# Altium schematic sheet RS485_RS232_Sheet.SchDoc
size A4; SheetNumber: 7; SheetTotal: 8
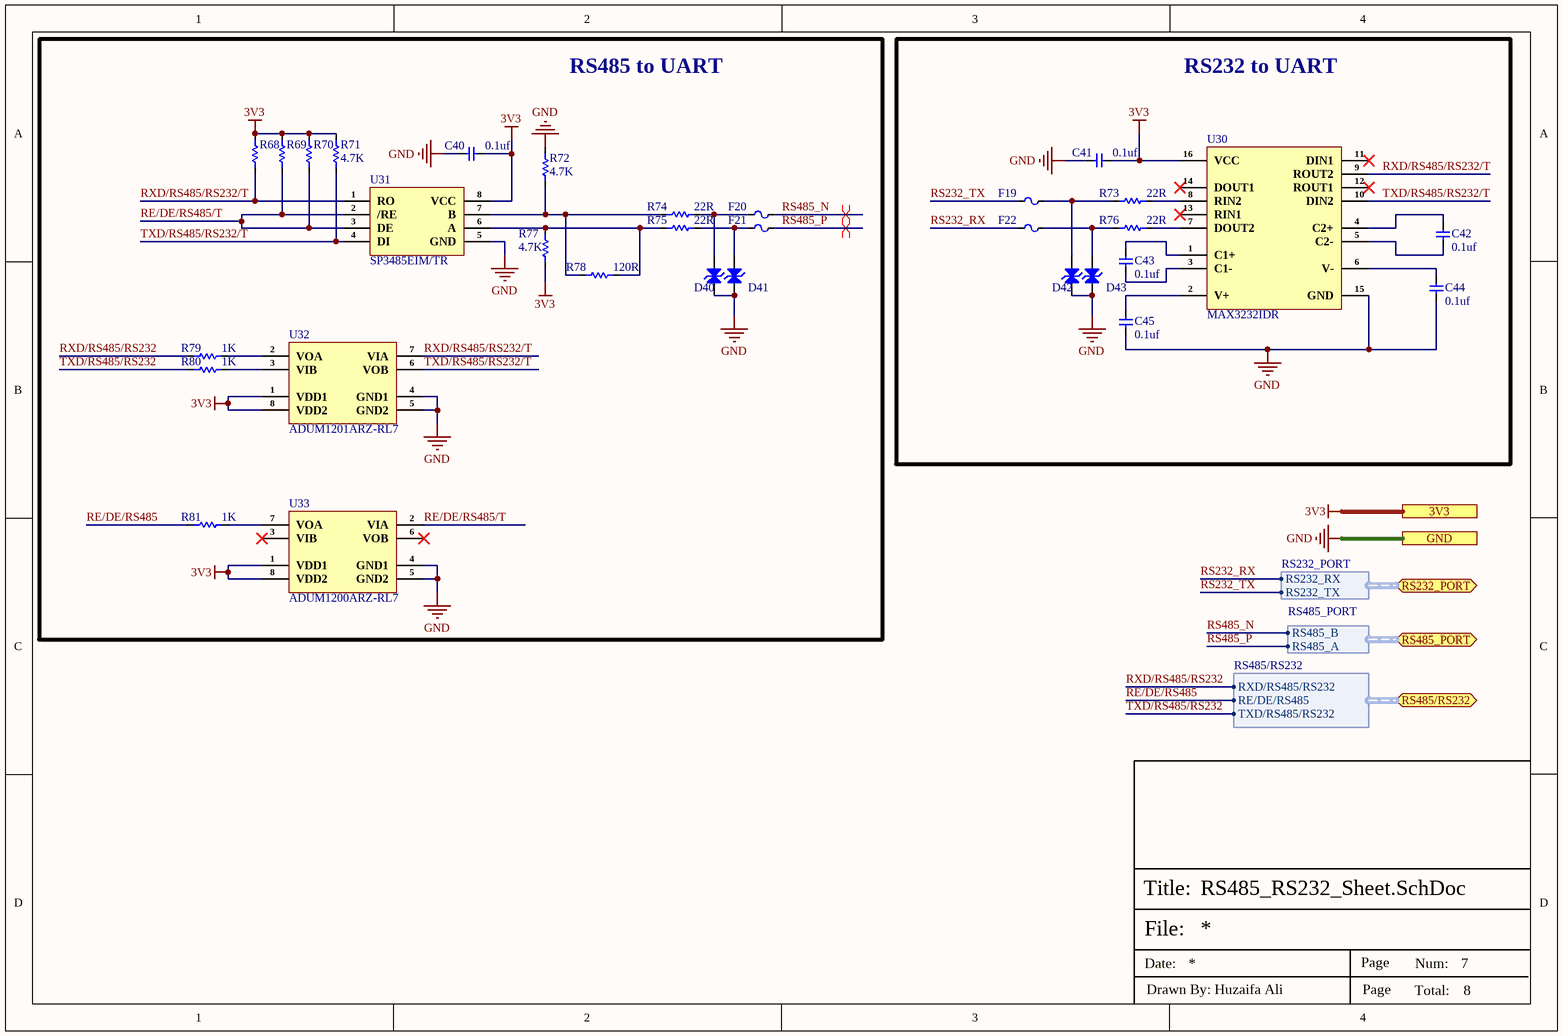
[diagram p0: RS485_RS232_Sheet.SchDoc]

## Parts
C40  0.1uf  [Cap-0402]
C41  0.1uf  [Cap-0402]
C42  0.1uf  [Cap-0402]
C43  0.1uf  [Cap-0402]
C44  0.1uf  [Cap-0402]
C45  0.1uf  [Cap-0402]
D40  SMBJ26CA  [SMB_]  (value not drawn)
D41  SMBJ26CA  [SMB_]  (value not drawn)
D42  SMBJ26CA  [SMB_]  (value not drawn)
D43  SMBJ26CA  [SMB_]  (value not drawn)
F19  SMD0805P020TF  [Fuse-0805]  (value not drawn)
F20  SMD0805P020TF  [Fuse-0805]  (value not drawn)
F21  SMD0805P020TF  [Fuse-0805]  (value not drawn)
F22  SMD0805P020TF  [Fuse-0805]  (value not drawn)
R68  4.7K  [Res-0402]  (value not drawn)
R69  4.7K  [Res-0402]  (value not drawn)
R70  4.7K  [Res-0402]  (value not drawn)
R71  4.7K  [Res-0402]
R72  4.7K  [Res-0402]
R73  22R  [Res-0402]
R74  22R  [Res-0402]
R75  22R  [Res-0402]
R76  22R  [Res-0402]
R77  4.7K  [Res-0402]
R78  120R  [Res-0603]
R79  1K  [Res-0201]
R80  1K  [Res-0201]
R81  1K  [Res-0201]
U30  MAX3232IDR  [SOIC-16]
U31  SP3485EIM/TR  [SOP-8]
U32  ADUM1201ARZ-RL7  [SOIC-8]
U33  ADUM1200ARZ-RL7  [SOIC-8]

## Blocks framed on the sheet
RS485 to UART: C40 D40 D41 F20 F21 R68-R72 R74 R75 R77-R81 U31-U33
RS232 to UART: C41-C45 D42 D43 F19 F22 R73 R76 U30

## Ports
3V3, GND, RS232_PORT (bidir, harness RS232_PORT), RS485/RS232 (bidir, harness RS485/RS232), RS485_PORT (bidir, harness RS485_PORT)

## Harnesses
RS485_PORT: RS485_B, RS485_A
RS232_PORT: RS232_RX, RS232_TX
RS485/RS232: RXD/RS485/RS232, RE/DE/RS485, TXD/RS485/RS232

## Nets
3V3: C40.1 C41.1 R68.2 R69.2 R70.2 R71.2 R77.1 U30.16(VCC) U31.8(VCC) U32.1(VDD1) U32.8(VDD2) U33.1(VDD1) U33.8(VDD2) ; port 3V3
GND: C40.2 C41.2 C44.2 C45.2 D40.1(A) D41.1(A) D42.1(A) D43.1(A) R72.2 U30.15(GND) U31.5(GND) U32.4(GND1) U32.5(GND2) U33.4(GND1) U33.5(GND2) ; port GND
RE/DE/RS485: R81.2 ; port RS485/RS232.RE/DE/RS485
RE/DE/RS485/T: R69.1 R70.1 U31.2(/RE) U31.3(DE) U33.2(VIA)
RS232_RX: F22.1 ; port RS232_PORT.RS232_RX
RS232_TX: F19.1 ; port RS232_PORT.RS232_TX
RS485_N: F20.2 ; port RS485_PORT.RS485_B
RS485_P: F21.2 ; port RS485_PORT.RS485_A
RXD/RS485/RS232: R79.2 ; port RS485/RS232.RXD/RS485/RS232
RXD/RS485/RS232/T: R68.1 U30.9(ROUT2) U31.1(RO) U32.7(VIA)
TXD/RS485/RS232: R80.2 ; port RS485/RS232.TXD/RS485/RS232
TXD/RS485/RS232/T: R71.1 U30.10(DIN2) U31.4(DI) U32.6(VOB)
NetC42_1: C42.1 U30.4(C2+)
NetC42_2: C42.2 U30.5(C2-)
NetC43_1: C43.1 U30.1(C1+)
NetC43_2: C43.2 U30.3(C1-)
NetC44_1: C44.1 U30.6(V-)
NetC45_1: C45.1 U30.2(V+)
NetD40_2: D40.2(K) F20.1 R74.2
NetD41_2: D41.2(K) F21.1 R75.2
NetD42_2: D42.2(K) F19.2 R73.1
NetD43_2: D43.2(K) F22.2 R76.1
NetR72_1: R72.1 R74.1 R78.1 U31.7(B)
NetR73_2: R73.2 U30.8(RIN2)
NetR75_1: R75.1 R77.2 R78.2 U31.6(A)
NetR76_2: R76.2 U30.7(DOUT2)
NetR79_1: R79.1 U32.2(VOA)
NetR80_1: R80.1 U32.3(VIB)
NetR81_1: R81.1 U33.7(VOA)

Not connected (* = marked no-connect by the designer): U30 11(DIN1)* 12(ROUT1)* 13(RIN1)* 14(DOUT1)*; U33 3(VIB)* 6(VOB)*

## Layout directives
differential pair; net class RS485; differential pair class RS485_LINES; rule Impedance Constraint [Min = 115.0    Max = 120.0    ]; rule Matched Net Lengths [Tolerance = 0.508mm]: RS485_N, RS485_P

## Notes on the sheet
- File:
- Title:
- Date:
- Page
- Num:
- Total:
- Drawn By: Huzaifa Ali

## Library data of the parts
C40-C45 = GRM155R62A104KE14D: CAP CER 0.1UF 100V X5R 0402; Manufacturer: Murata; Capacitance: 100nF; Tolerance: 10%; Item Type: Capacitor; Supplier 1: Arrow Electronics; Manufacturer Part Number: GRM155R62A104KE14D; RoHS: Yes; Category: Ceramic Capacitors; Stock 1: 870000; Pricing 1: 10000=0.00500, 20000=0.00410, 30000=0.00390, 50000=0.00370, 100000=0.00300 (USD); Mount: Surface Mount; Case/Package: 0402; Case Code (Metric): 1005; Case Code (Imperial): 0402; Weight: 0.000212oz; Min Operating Temperature: -55°C; Max Operating Temperature: 85°C; Packaging: Tape and Reel; Voltage Rating: 100V; Dielectric: X5R; Termination: SMD/SMT; Voltage Rating (DC): 100V; Package Quantity: 10000; Series: GRM; Length: 0.039inch; Width: 0.02inch; Height: 0.5mm; Thickness: 0.022inch; Reach SVHC Compliant: Yes; Lead Free: Lead Free; RoHS Compliant: Yes; ComponentLink1URL: http://www.farnell.com/datasheets/2079151.pdf?src-supplier=Farnell; ComponentLink1Description: http://www.farnell.com/datasheets/2079151.pdf?src-supplier=Farnell; ComponentLink2URL: http://www.mouser.com/ds/2/281/c02e-2905.pdf?src-supplier=Mouser; ComponentLink2Description: http://www.mouser.com/ds/2/281/c02e-2905.pdf?src-supplier=Mouser; ComponentLink3URL: http://www.farnell.com/datasheets/2079151.pdf?src-supplier=Element14; ComponentLink3Description: http://www.farnell.com/datasheets/2079151.pdf?src-supplier=Element14; ComponentLink4URL: http://search.murata.co.jp/Ceramy/image/img/A01X/G101/ENG/GRM155R62A104KE14-01.pdf?src-supplier=Digi-Key; ComponentLink4Description: http://search.murata.co.jp/Ceramy/image/img/A01X/G101/ENG/GRM155R62A104KE14-01.pdf?src-supplier=Digi-Key; ComponentLink5URL: http://www.farnell.com/datasheets/2079151.pdf?src-supplier=Newark; ComponentLink5Description: http://www.farnell.com/datasheets/2079151.pdf?src-supplier=Newark; Supplier Part Number 1: GRM155R62A104KE14D; LCSC Part Number: C162178
D40-D43 = SMBJ26CA: SMB(DO-214AA) TVS ROHS; Manufacturer: MSKSEMI; Item Type: Diode; Manufacturer Part Number: SMBJ26CA; Package: SMB(DO-214AA); LCSC Part Number: C5331111; ComponentLink1Description: LCSC; ComponentLink1URL: https://www.lcsc.com/product-detail/TVS_MSKSEMI-SMBJ26CA_C5331111.html
F19-F22 = SMD0805P020TF: 9V 200mA 100A 500mA 0805 Resettable Fuses ROHS; Manufacturer: RUILON; Item Type: Fuse; Manufacturer Part Number: SMD0805P020TF; Package: 0805; LCSC Part Number: C20976; ComponentLink1Description: LCSC; ComponentLink1URL: https://www.lcsc.com/product-detail/Resettable-Fuses_RUILON-Shenzhen-Ruilongyuan-Elec-SMD0805P020TF_C20976.html
R68-R72 R77 = RC0402FR-074K7L: RES 4.7K OHM 1% 1/16W 0402; Manufacturer: Yageo; Voltage Rating (DC): 50V; Power Rating: 62.5mW; Resistance: 4.7kR; Temperature Coefficient: 100ppm/°C; Max Power Dissipation: 63mW; Item Type: Resistor; Supplier 1: Avnet; Manufacturer Part Number: RC0402FR-074K7L; RoHS: Yes; Category: Chip SMD Resistors; Stock 1: 2420000; Pricing 1: 10000=0.00085 (USD); Case/Package: 0402; Number of Pins: 2; Case Code (Imperial): 0402; Case Code (Metric): 1005; Size Code: 0402; Min Operating Temperature: -55°C; Max Operating Temperature: 155°C; Tolerance: 1%; Voltage Rating: 50V; Packaging: Tape and Reel; Resistor Type: Thick Film; Termination: SMD/SMT; Features: Moisture Resistant; Series: RC; Number of Terminations: 2; Resistance Tolerance: 1%; Construction: Rectangular; Length: 1mm; Width: 0.5mm; Height: 0.32mm; Depth: 0.5mm; Height - Seated (Max): 0.016inch; RoHS Compliant: Yes; Reach SVHC Compliant: Yes; Military Standard: Not; Lead Free: Lead Free; ComponentLink1URL: https://datasheet.ciiva.com/22661/1686128-22661342.pdf?src-supplier=Element14; ComponentLink1Description: https://datasheet.ciiva.com/22661/1686128-22661342.pdf?src-supplier=Element14; ComponentLink2URL: https://datasheet.ciiva.com/7850/1018594-7850022.pdf?src-supplier=Element14; ComponentLink2Description: https://datasheet.ciiva.com/7850/1018594-7850022.pdf?src-supplier=Element14; ComponentLink3URL: https://datasheet.ciiva.com/7850/1018594-7850023.pdf?src-supplier=Element14; ComponentLink3Description: https://datasheet.ciiva.com/7850/1018594-7850023.pdf?src-supplier=Element14; ComponentLink4URL: https://datasheet.ciiva.com/15215/getdatasheetpartid-328119-15215035.pdf?src-supplier=Verical; ComponentLink4Description: https://datasheet.ciiva.com/15215/getdatasheetpartid-328119-15215035.pdf?src-supplier=Verical; Supplier Part Number 1: RC0402FR-074K7L; LCSC Part Number: C105871
R73-R76 = RCS040222R0FKED: RES SMD 22 OHM 1% 1/5W 0402; Manufacturer: Vishay Dale; Max Power Dissipation: 200mW; Temperature Coefficient: 100ppm/°C; Supplier 1: Digi-Key; Manufacturer Part Number: RCS040222R0FKED; Stock 1: 8456; Pricing 1: 1=0.12, 10=0.105, 100=0.0402, 1000=0.01771, 2500=0.0153, 5000=0.01368 (USD); Case/Package: 0402; Case Code (Metric): 1005; Case Code (Imperial): 0402; Min Operating Temperature: -55°C; Max Operating Temperature: 155°C; Packaging: Tape and Reel; Resistance: 22R; Resistor Type: Thick Film; Number of Terminations: 2; Tolerance: 1%; Features: Automotive AEC-Q200; Length: 0.039inch; Width: 0.02inch; Height: 0.016inch; RoHS Compliant: Yes; ComponentLink1URL: http://www.vishay.com/docs/20065/rcse3.pdf?src-supplier=Digi-Key; ComponentLink1Description: http://www.vishay.com/docs/20065/rcse3.pdf?src-supplier=Digi-Key; Supplier Part Number 1: 541-2880-1-ND; LCSC Part Number: C2086081
R78 = RC0603FR-07120RL: RES 120 OHM 1% 1/10W 0603; Manufacturer: Yageo; Temperature Coefficient: 100ppm/°C; Voltage Rating (DC): 50V; Power Rating: 100mW; Supplier 1: Digi-Key; Manufacturer Part Number: RC0603FR-07120RL; RoHS: Yes; Category: Chip SMD Resistors; Stock 1: 839061; Pricing 1: 1=0.10000, 10=0.02400, 100=0.00970, 1000=0.00436, 2500=0.00378 (USD); Case/Package: 0603; Number of Pins: 2; Case Code (Metric): 1608; Case Code (Imperial): 0603; Size Code: 0603; Min Operating Temperature: -55°C; Max Operating Temperature: 155°C; Resistance: 120R; Tolerance: 1%; Resistor Type: Thick Film; Packaging: Tape and Reel; Voltage Rating: 50V; Package Quantity: 1; Number of Terminations: 2; Termination: SMD/SMT; Max Power Dissipation: 100mW; Features: Moisture Resistant; Series: RC; Construction: Rectangular; Resistance Tolerance: 1%; Length: 1.6mm; Width: 0.031inch; Height: 0.022inch; Depth: 0.8mm; REACH SVHC: No SVHC; Lead Free: Lead Free; Military Standard: Not; RoHS Compliant: Yes; ComponentLink1URL: https://datasheet.ciiva.com/2553/pyu-r-int-thick-7-2553512.pdf?src-supplier=Digi-Key; ComponentLink1Description: https://datasheet.ciiva.com/2553/pyu-r-int-thick-7-2553512.pdf?src-supplier=Digi-Key; ComponentLink2URL: https://datasheet.ciiva.com/7746/443971-7746248.pdf?src-supplier=Element14; ComponentLink2Description: https://datasheet.ciiva.com/7746/443971-7746248.pdf?src-supplier=Element14; ComponentLink3URL: https://datasheet.ciiva.com/2553/pyu-r-int-thick-7-2553513.pdf?src-supplier=Digi-Key; ComponentLink3Description: https://datasheet.ciiva.com/2553/pyu-r-int-thick-7-2553513.pdf?src-supplier=Digi-Key; ComponentLink4URL: https://datasheet.ciiva.com/7746/443971-7746249.pdf?src-supplier=Element14; ComponentLink4Description: https://datasheet.ciiva.com/7746/443971-7746249.pdf?src-supplier=Element14; ComponentLink5URL: https://datasheet.ciiva.com/2553/pyu-r-int-thick-7-2553514.pdf?src-supplier=Digi-Key; ComponentLink5Description: https://datasheet.ciiva.com/2553/pyu-r-int-thick-7-2553514.pdf?src-supplier=Digi-Key; ComponentLink6URL: https://datasheet.ciiva.com/46395/443971-46395021.pdf?src-supplier=Element14; ComponentLink6Description: https://datasheet.ciiva.com/46395/443971-46395021.pdf?src-supplier=Element14; Supplier Part Number 1: 311-120HRCT-ND; LCSC Part Number: C114640
R79-R81 = RC0201FR-071KP: RES 1K OHM 1% 1/20W 0201; Manufacturer: Yageo; Supplier 1: Digi-Key; Manufacturer Part Number: RC0201FR-071KP; RoHS: Yes; Stock 1: 4800; Pricing 1: 1=0.11000, 10=0.10200, 100=0.03940, 1000=0.01734, 2500=0.01497, 5000=0.01340 (USD); RoHS Compliant: Yes; Supplier Part Number 1: 13-RC0201FR-071KPCT-ND; LCSC Part Number: C3953443
U30 = MAX3232IDR: IC TRANSCEIVER FULL 2/2 16SOIC; Manufacturer: Texas Instruments; Min Supply Voltage: 3V; Max Supply Voltage: 5.5V; Data Rate: 250Kbps; Number of Receivers: 2; Operating Supply Voltage: 5V; Logic Function: Transceiver,Receiver; Number of Transceivers: 1; Supply Current: 1mA; Simplex/Duplex: Full Duplex; Receiver Hysteresis: 300mV; Supplier 1: Mouser; Manufacturer Part Number: MAX3232IDR; RoHS: Yes; Category: Interface ICs; Stock 1: 22181; Pricing 1: 1=2.37, 10=2.37, 50=2.37, 100=2.37, 1000=2.37, 10000=2.37 (USD); Mounting Technology: Surface Mount; Case/Package: D; Pins: 16; Weight: 0.004998oz; Min Operating Temperature: -40°C; Max Operating Temperature: 85°C; Packaging: Tape and Reel; Package Quantity: 1; Number of Transmitters: 2; Number of Drivers: 2; Series: -; Operating Supply Current: 1mA; Lead Free: Lead Free; RoHS Compliant: Yes; Reach SVHC Compliant: No; ComponentLink1URL: https://datasheet.ciiva.com/8064/1882754-8064745.pdf?src-supplier=Element14; ComponentLink1Description: https://datasheet.ciiva.com/8064/1882754-8064745.pdf?src-supplier=Element14; ComponentLink2URL: https://datasheet.ciiva.com/46394/1882754-46394523.pdf?src-supplier=Element14; ComponentLink2Description: https://datasheet.ciiva.com/46394/1882754-46394523.pdf?src-supplier=Element14; ComponentLink3URL: https://datasheet.ciiva.com/46397/1882754-46397996.pdf?src-supplier=Element14; ComponentLink3Description: https://datasheet.ciiva.com/46397/1882754-46397996.pdf?src-supplier=Element14; ComponentLink4URL: https://datasheet.ciiva.com/1701/max3232-1701626.pdf?src-supplier=Digi-Key; ComponentLink4Description: https://datasheet.ciiva.com/1701/max3232-1701626.pdf?src-supplier=Digi-Key; ComponentLink5URL: https://datasheet.ciiva.com/1701/max3232-1701625.pdf?src-supplier=Digi-Key; ComponentLink5Description: https://datasheet.ciiva.com/1701/max3232-1701625.pdf?src-supplier=Digi-Key; ComponentLink6URL: https://datasheet.ciiva.com/1701/max3232-1701627.pdf?src-supplier=Digi-Key; ComponentLink6Description: https://datasheet.ciiva.com/1701/max3232-1701627.pdf?src-supplier=Digi-Key; Supplier Part Number 1: 595-MAX3232IDR; LCSC Part Number: C18261; Item Type: IC
U31 = SP3485EIM/TR: SOP-8 RS-485/RS-422 ICs ROHS; Manufacturer: HGSEMI; Item Type: IC; Manufacturer Part Number: SP3485EIM/TR; Package: SOP-8; LCSC Part Number: C519086; ComponentLink1Description: LCSC; ComponentLink1URL: https://www.lcsc.com/product-detail/RS-485-RS-422-ICs_HGSEMI-SP3485EIM-TR_C519086.html
U32 = ADUM1201ARZ-RL7: DGTL ISO 2.5KV GEN PURP 8SOIC; Manufacturer: Analog Devices; Number of Channels: 2; Propagation Delay: 150ns; Min Supply Voltage: 2.7V; Max Supply Voltage: 5.5V; Data Rate: 25Mbps; Channel Type: Unidirectional; Polarity: Bidirectional; Operating Supply Current: 600uA; ESD Protection: No; Output Current: 35mA; Pulse Width Distortion (PWD): 40ns; Voltage: 5V; Approvals: UL,CSA,VDE; Item Type: IC; Supplier 1: Arrow Electronics; Manufacturer Part Number: ADUM1201ARZ-RL7; RoHS: Yes; Category: Interface ICs; Stock 1: 710; Pricing 1: 1=3.9521, 10=3.5429, 25=3.3533, 100=2.9042, 250=2.7545, 500=2.475, 1000=2.2037 (USD); Case/Package: R; Pins: 8; Weight: 0.019048oz; Min Operating Temperature: -40°C; Max Operating Temperature: 125°C; Packaging: Tape and Reel; Turn-On Delay Time: 150ns; Isolated Power: No; Type: General Purpose; Max Supply Current: 600uA; Series: iCoupler®; Radiation Hardening: No; Lead Free: Contains Lead; RoHS Compliant: Yes; ComponentLink1URL: https://datasheet.ciiva.com/15119/getdatasheetpartid-121048-15119389.pdf?src-supplier=Verical; ComponentLink1Description: https://datasheet.ciiva.com/15119/getdatasheetpartid-121048-15119389.pdf?src-supplier=Verical; ComponentLink2URL: https://datasheet.ciiva.com/15367/adum1200-1201-279454-15367752.pdf?src-supplier=Mouser; ComponentLink2Description: https://datasheet.ciiva.com/15367/adum1200-1201-279454-15367752.pdf?src-supplier=Mouser; ComponentLink3URL: https://datasheet.ciiva.com/3149/adum1200-1201-3149740.pdf?src-supplier=Avnet; ComponentLink3Description: https://datasheet.ciiva.com/3149/adum1200-1201-3149740.pdf?src-supplier=Avnet; ComponentLink4URL: https://datasheet.ciiva.com/3148/adum1200-1201-3148345.pdf?src-supplier=Avnet; ComponentLink4Description: https://datasheet.ciiva.com/3148/adum1200-1201-3148345.pdf?src-supplier=Avnet; ComponentLink5URL: https://datasheet.ciiva.com/2081/adum1200-1201-2081793.pdf?src-supplier=Digi-Key; ComponentLink5Description: https://datasheet.ciiva.com/2081/adum1200-1201-2081793.pdf?src-supplier=Digi-Key; ComponentLink6URL: https://datasheet.ciiva.com/2081/adum1200-1201-2081794.pdf?src-supplier=Digi-Key; ComponentLink6Description: https://datasheet.ciiva.com/2081/adum1200-1201-2081794.pdf?src-supplier=Digi-Key; ComponentLink7URL: https://datasheet.ciiva.com/2081/adum1200-1201-2081792.pdf?src-supplier=Digi-Key; ComponentLink7Description: https://datasheet.ciiva.com/2081/adum1200-1201-2081792.pdf?src-supplier=Digi-Key; Supplier Part Number 1: ADUM1201ARZ-RL7; LCSC Part Number: C9669
U33 = ADUM1200ARZ-RL7: DGTL ISO 2.5KV GEN PURP 8SOIC; Manufacturer: Analog Devices; Number of Channels: 2; Propagation Delay: 150ns; Min Supply Voltage: 2.7V; Operating Supply Voltage: 3.3V; Max Supply Voltage: 5.5V; Data Rate: 25Mbps; Channel Type: Unidirectional; Output Current: 35mA; Isolated Power: No; Pulse Width Distortion (PWD): 40ns; Supply Current: 600uA; Item Type: IC; Supplier 1: Arrow Electronics; Manufacturer Part Number: ADUM1200ARZ-RL7; RoHS: Yes; Category: Interface ICs; Stock 1: 14777; Pricing 1: 1=3.887, 10=3.493, 25=3.295, 100=2.865, 250=2.706, 500=2.425, 1000=2.066, 3000=2.048, 6000=2.025 (USD); Case/Package: R; Pins: 8; Min Operating Temperature: -40°C; Max Operating Temperature: 125°C; Packaging: Tape and Reel; Package Quantity: 1000; Turn-On Delay Time: 150ns; Type: General Purpose; Series: iCoupler®; Radiation Hardening: No; Lead Free: Contains Lead; RoHS Compliant: Yes; ComponentLink1URL: https://datasheet.ciiva.com/15119/getdatasheetpartid-258305-15119482.pdf?src-supplier=Verical; ComponentLink1Description: https://datasheet.ciiva.com/15119/getdatasheetpartid-258305-15119482.pdf?src-supplier=Verical; ComponentLink2URL: https://datasheet.ciiva.com/30514/1805054-30514023.pdf?src-supplier=Jameco; ComponentLink2Description: https://datasheet.ciiva.com/30514/1805054-30514023.pdf?src-supplier=Jameco; ComponentLink3URL: https://datasheet.ciiva.com/3148/adum1200-1201-3148342.pdf?src-supplier=Avnet; ComponentLink3Description: https://datasheet.ciiva.com/3148/adum1200-1201-3148342.pdf?src-supplier=Avnet; ComponentLink4URL: https://datasheet.ciiva.com/2081/adum1200-1201-2081796.pdf?src-supplier=Digi-Key; ComponentLink4Description: https://datasheet.ciiva.com/2081/adum1200-1201-2081796.pdf?src-supplier=Digi-Key; ComponentLink5URL: https://datasheet.ciiva.com/2081/adum1200-1201-2081797.pdf?src-supplier=Digi-Key; ComponentLink5Description: https://datasheet.ciiva.com/2081/adum1200-1201-2081797.pdf?src-supplier=Digi-Key; ComponentLink6URL: https://datasheet.ciiva.com/2081/adum1200-1201-2081795.pdf?src-supplier=Digi-Key; ComponentLink6Description: https://datasheet.ciiva.com/2081/adum1200-1201-2081795.pdf?src-supplier=Digi-Key; Supplier Part Number 1: ADUM1200ARZ-RL7; LCSC Part Number: C15219